# Altium schematic sheet Game_Controller.SchDoc
size A4; SheetNumber: 1; SheetTotal: 7
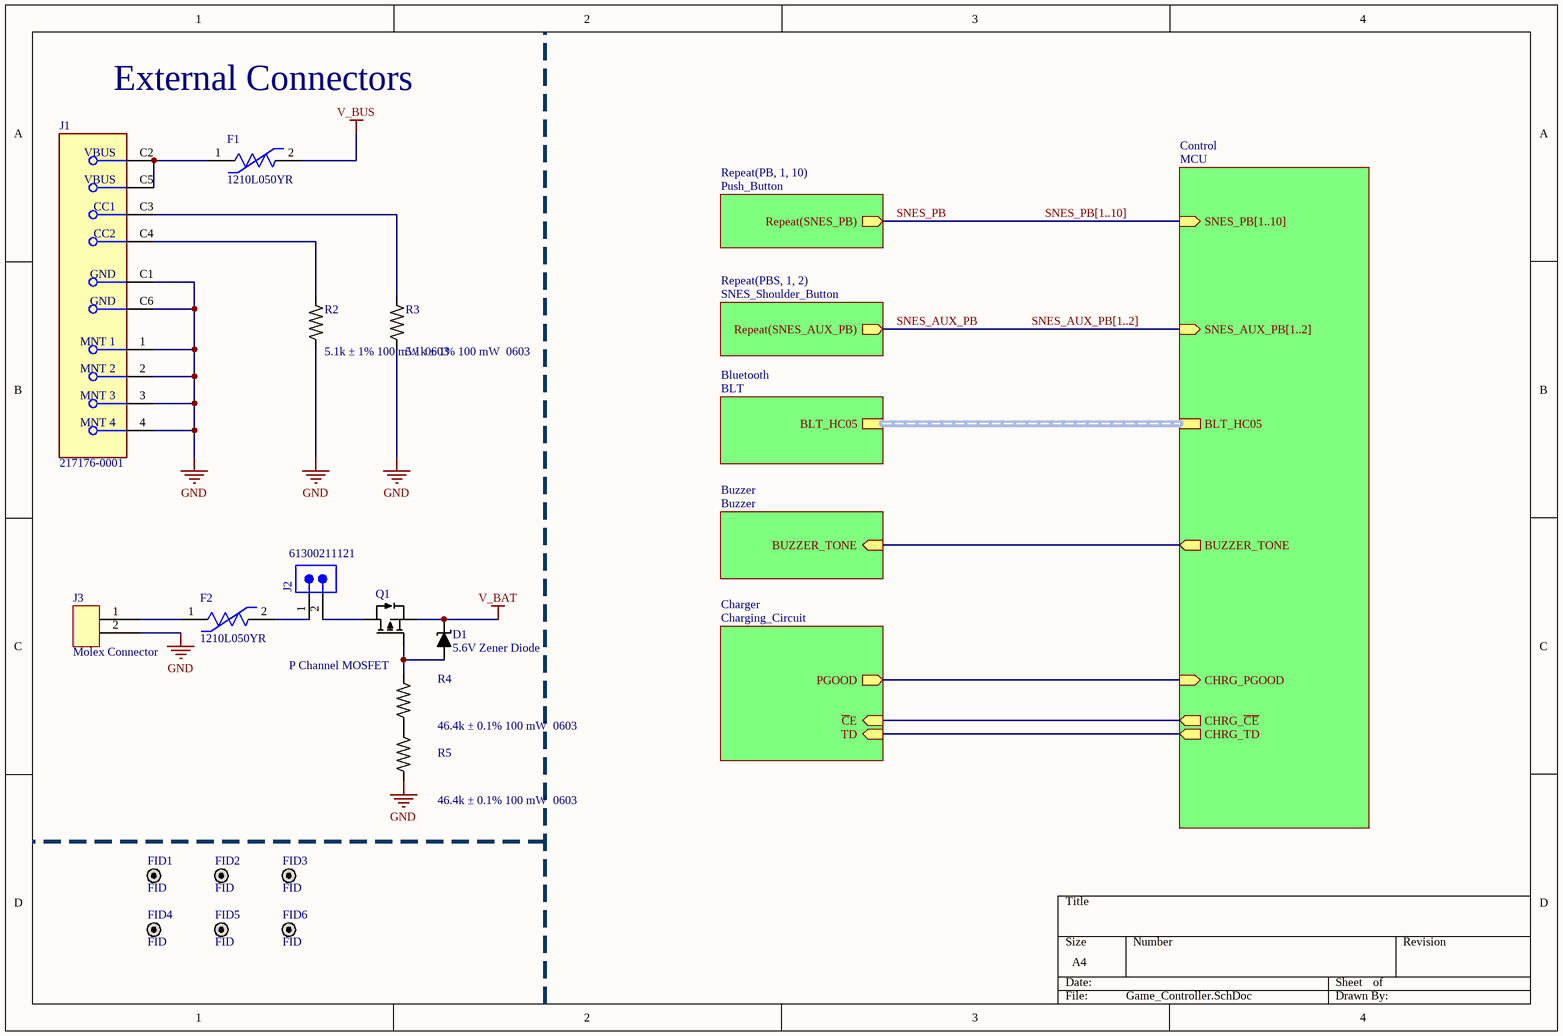
[diagram p0: Game_Controller.SchDoc]

## Parts
D1  5.6V Zener Diode  [SOT23-3]
F1  1210L050YR  [FP-1210L050YR-MFG]
F2  1210L050YR  [FP-1210L050YR-MFG]
FID1  FID  [FID]
FID2  FID  [FID]
FID3  FID  [FID]
FID4  FID  [FID]
FID5  FID  [FID]
FID6  FID  [FID]
J1  217176-0001  [FP-217176-0001-MFG]
J2  61300211121  [61300211121]
J3  Molex Connector  [B2B-PH-K-S]
Q1  P Channel MOSFET  [SOT23-3]
R2  5.1k ± 1% / 100 mW / 0603  [0603_RES]
R3  5.1k ± 1% / 100 mW / 0603  [0603_RES]
R4  46.4k ± 0.1% / 100 mW / 0603  [0603_RES]
R5  46.4k ± 0.1% / 100 mW / 0603  [0603_RES]

## Sub-sheets
Bluetooth = BLT: BLT_HC05 (harness BLT_HC05_BUS)
Buzzer = Buzzer: BUZZER_TONE (in)
Charger = Charging_Circuit: ~{C}E (in), TD (in), PGOOD (out)
Control = MCU: BLT_HC05 (harness BLT_HC05_BUS), CHRG_~{CE} (out), CHRG_TD (out), CHRG_PGOOD (in), SNES_PB[1..10] (in), SNES_AUX_PB[1..2] (in), BUZZER_TONE (out)
Repeat(PB, 1, 10) = Push_Button: Repeat(SNES_PB) (out)
Repeat(PBS, 1, 2) = SNES_Shoulder_Button: Repeat(SNES_AUX_PB) (out)

## Nets
GND: J1.1(MNT_1) J1.2(MNT_2) J1.3(MNT_3) J1.4(MNT_4) J1.C1(GND) J1.C6(GND) J3.2 R2.1 R3.1 R5.2
V_BAT: D1.3(K) Q1.2(S)
V_BUS: F1.2
SNES_AUX_PB: sheet Repeat(PBS, 1, 2)/Repeat(SNES_AUX_PB)
SNES_PB: sheet Repeat(PB, 1, 10)/Repeat(SNES_PB)
NetD1_1: D1.1(A) Q1.1(G) R4.1
NetF1_1: F1.1 J1.C2(VBUS) J1.C5(VBUS)
NetF2_1: F2.1 J3.1
NetF2_2: F2.2 J2.1
NetJ1_C3: J1.C3(CC1) R3.2
NetJ1_C4: J1.C4(CC2) R2.2
NetJ2_2: J2.2 Q1.3(D)
NetR4_2: R4.2 R5.1
(unnamed): sheet Charger/~{C}E, sheet Control/CHRG_~{CE}
(unnamed): sheet Charger/TD, sheet Control/CHRG_TD
(unnamed): sheet Charger/PGOOD, sheet Control/CHRG_PGOOD
(unnamed): sheet Control/BUZZER_TONE, sheet Buzzer/BUZZER_TONE

## Buses and harness runs
bus SNES_AUX_PB[1..2] = sheet Control/SNES_AUX_PB[1..2]
bus SNES_PB[1..10] = sheet Control/SNES_PB[1..10]
harness sheet Bluetooth/BLT_HC05 = sheet Control/BLT_HC05

## Notes on the sheet
- External Connectors

## Library data of the parts
D1 = 29: Manufacturer: Vishay; CID: 29; Manufacturer Part Number: BZX84C5V6-E3-08
F1 F2 = CMP-08606-000067-1: PTC RESET FUSE 13.2V 500MA 1210; Approvals: cULus; Resistance: 900mR; Time to Trip: 0.1s; Max Current Rating: 100A; Trip Current: 1A; Max Power Dissipation: 600mW; Case Code (Metric): 3225; Min Operating Temperature: -40°C; Max Voltage Rating (DC): 13.2V; Hold Current: 500mA; Working Voltage: 13.2V; Termination: SMD/SMT; Case Code (Imperial): 1210; Current Rating: 100A; REACH SVHC: No SVHC; Width: 2.8mm; Lead Free: Lead Free; Length: 3.43mm; Voltage Rating (DC): 13.2V; Packaging: Tape and Reel; Terminal Material: Copper; Voltage Rating: 13.2V; Height: 0.85mm; Case/Package: 1210; Package Quantity: 4000; Max Operating Temperature: 85°C; Power Dissipation: 600mW; Operating Supply Voltage: 13.2V
J1 = CMP-04767-000013-1: CONN RCPT TYPE C 24POS SMD RA
J2 = CMP-1712-00002-7: THT Vertical Pin Header WR-PHD, Pitch 2.54 mm, Single Row, 2 pins; Pitch: 2.54mm; Number of Contacts: 2; Connector Type: Male Pin; Gender: Male; Contact Resistance: 20mΩ; Operating Supply Voltage: 250V; Current Rating: 3A; Housing Material: PBT; RoHS: Compliant; Lead Free: Lead Free; Contact Material: Gold; REACH SVHC: No; Min Operating Temperature: -40°C; Termination: Through Hole; Number of Pins: 2; Contact Gender: Male; Packaging: Bulk; Lead Pitch: 2.54mm; Contact Plating: Gold; Orientation: Vertical; Mount: Through Hole; Height: 8.94mm; Color: Black; Number of Positions: 2; Contact Mating Length: 5.9944mm; Max Operating Temperature: 105°C; Voltage Rating: 250V; Number of Rows: 1
J3 = 18: CID: 18; Manufacturer: Molex; Manufacturer Part Number: B2B-PH-K-S
Q1 = 28: Manufacturer: Vishay; CID: 28; Manufacturer Part Number: SI2301CDS-T1-E3
R2 R3 = 17: Manufacturer: Bourns; Manufacturer Part Number: CR0603-FX-5101ELF; CID: 17
R4 R5 = 7: Manufacturer: Yageo; Manufacturer Part Number: RT0603BRD0746K4L; CID: 7